# Altium schematic sheet Peripherals.SchDoc (part 1 of 2)
size A4; SheetNumber: 3; SheetTotal: 7
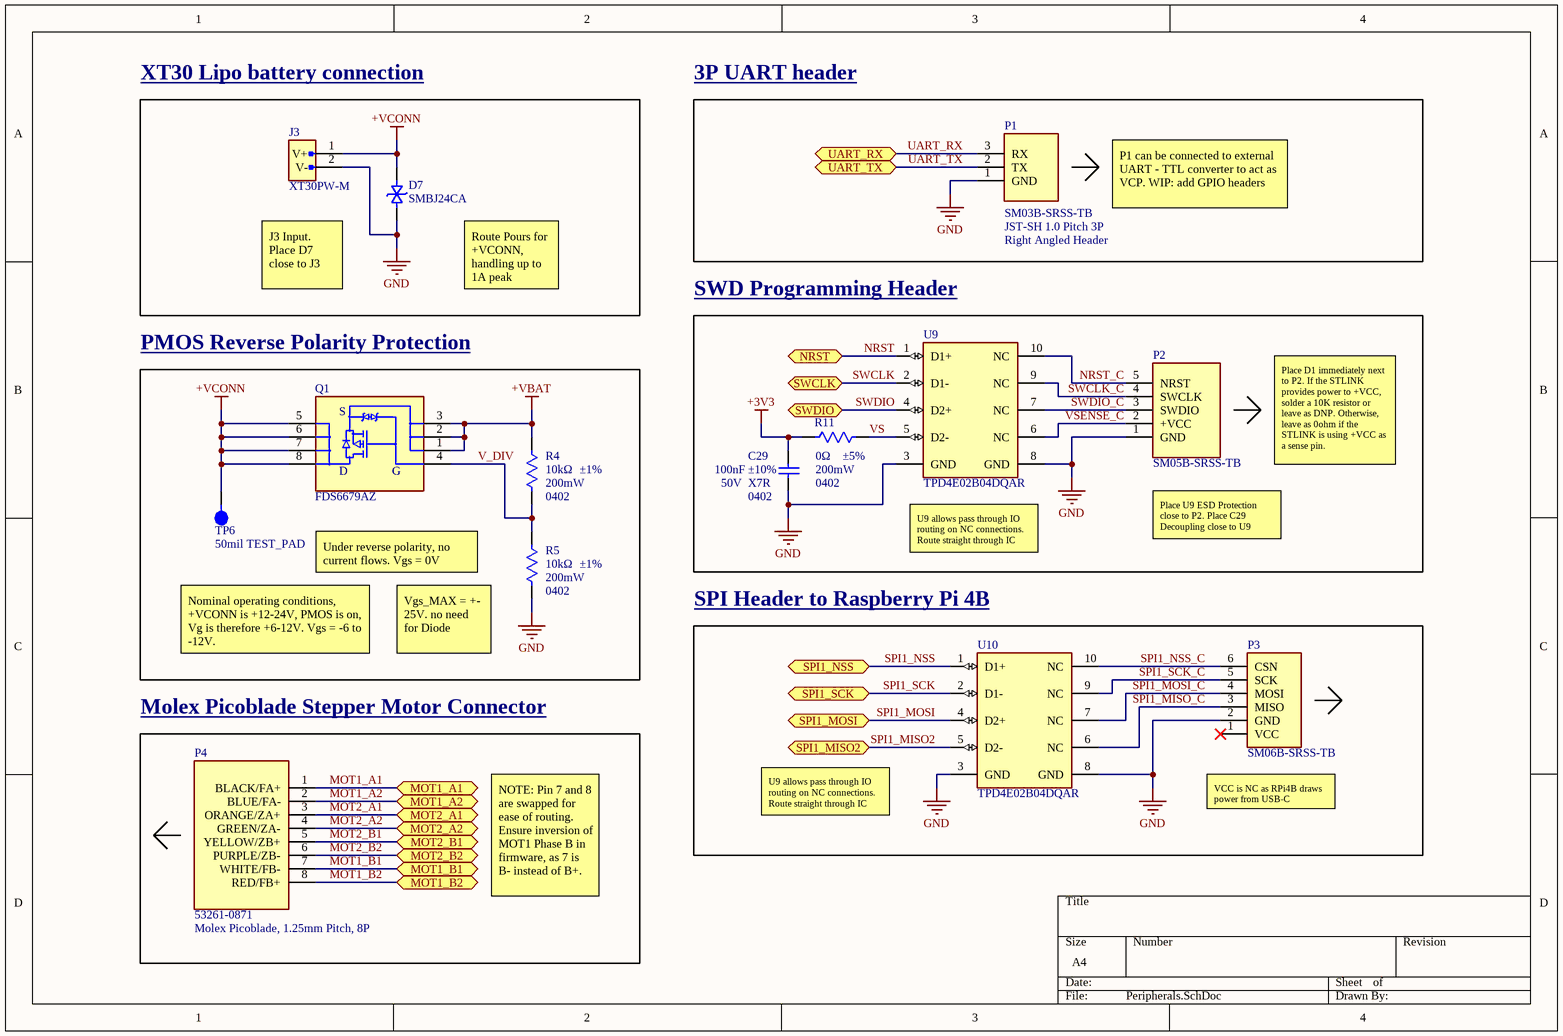
[diagram p0: Peripherals.SchDoc]

## Parts
C29  Case/Package: 0402  Voltage Rating: 50V  Dielectric: X7R  Tolerance: ±10%  [0402_Cap]  (hidden comment: 100nF)
D7  SMBJ24CA  [SMBJSeries_LTF]
J3  XT30PW-M  [AMASS_XT30PW-M]
P1  SM03B-SRSS-TB  [SM03B-SRSS-TB]
P2  SM05B-SRSS-TB  [SM05B-SRSS-TB]
P3  SM06B-SRSS-TB  [SM06B-SRSS-TB]
P4  53261-0871  [FP-532610871-MFG]
Q1  FDS6679AZ  [SOIC8_751EB_ONS]
R4  Tolerance: ±1%  Power Rating: 200mW  Case/Package: 0402  Resistance: 10kΩ  [0402_RES]  (hidden comment: 10K)
R5  Tolerance: ±1%  Power Rating: 200mW  Case/Package: 0402  Resistance: 10kΩ  [0402_RES]  (hidden comment: 10K)
R11  Tolerance: ±5%  Power Rating: 200mW  Case/Package: 0402  Resistance: 0Ω  [0402_RES]  (hidden comment: 0R)
TP6  50mil TEST_PAD  [15mil_TEST_PAD]
U9  TPD4E02B04DQAR  [FP-DQA0010A-MFG]
U10  TPD4E02B04DQAR  [FP-DQA0010A-MFG]

## Blocks framed on the sheet
XT30 Lipo battery connection: D7 J3
3P UART header: P1
SWD Programming Header: C29 P2 R11 U9
PMOS Reverse Polarity Protection: Q1 R4 R5 TP6
SPI Header to Raspberry Pi 4B: P3 U10
Molex Picoblade Stepper Motor Connector: P4

## Ports
MOT1_A1 (bidir), MOT1_A2 (bidir), MOT1_B1 (bidir), MOT1_B2 (bidir), MOT2_A1 (bidir), MOT2_A2 (bidir), MOT2_B1 (bidir), MOT2_B2 (bidir), NRST (bidir), SPI1_MISO2 (bidir), SPI1_MOSI (bidir), SPI1_NSS (bidir), SPI1_SCK (bidir), SWCLK (bidir), SWDIO (bidir), UART_RX (bidir), UART_TX (bidir)

## Nets
+3V3: C29.2 R11.1
+VBAT: Q1.1 Q1.2 Q1.3 R4.2
+VCONN: D7.2 J3.1(V+) Q1.5 Q1.6 Q1.7 Q1.8 TP6.1
GND: C29.1 D7.1 J3.2(V-) P1.1(GND) P2.1(GND) P3.2(GND) R5.1 U9.3(GND) U9.8(GND) U10.3(GND) U10.8(GND)
MOT1_A1: P4.1(BLACK/FA+) ; port MOT1_A1
MOT1_A2: P4.2(BLUE/FA-) ; port MOT1_A2
MOT1_B1: P4.7(WHITE/FB-) ; port MOT1_B1
MOT1_B2: P4.8(RED/FB+) ; port MOT1_B2
MOT2_A1: P4.3(ORANGE/ZA+) ; port MOT2_A1
MOT2_A2: P4.4(GREEN/ZA-) ; port MOT2_A2
MOT2_B1: P4.5(YELLOW/ZB+) ; port MOT2_B1
MOT2_B2: P4.6(PURPLE/ZB-) ; port MOT2_B2
NRST: U9.1(D1+) ; port NRST
NRST_C: P2.5(NRST) U9.10(NC)
SPI1_MISO2: U10.5(D2-) ; port SPI1_MISO2
SPI1_MISO_C: P3.3(MISO) U10.6(NC)
SPI1_MOSI: U10.4(D2+) ; port SPI1_MOSI
SPI1_MOSI_C: P3.4(MOSI) U10.7(NC)
SPI1_NSS: U10.1(D1+) ; port SPI1_NSS
SPI1_NSS_C: P3.6(CSN) U10.10(NC)
SPI1_SCK: U10.2(D1-) ; port SPI1_SCK
SPI1_SCK_C: P3.5(SCK) U10.9(NC)
SWCLK: U9.2(D1-) ; port SWCLK
SWCLK_C: P2.4(SWCLK) U9.9(NC)
SWDIO: U9.4(D2+) ; port SWDIO
SWDIO_C: P2.3(SWDIO) U9.7(NC)
UART_RX: P1.3(RX) ; port UART_RX
UART_TX: P1.2(TX) ; port UART_TX
V_DIV: Q1.4(G) R4.1 R5.2
VS: R11.2 U9.5(D2-)
VSENSE_C: P2.2(+VCC) U9.6(NC)

Not connected (* = marked no-connect by the designer): P3 1(VCC)*

## Notes on the sheet
- (near P1) JST-SH 1.0 Pitch 3P
- Right Angled Header
- P1 can be connected to external UART - TTL converter to act as VCP. WIP: add GPIO headers
- J3 Input. Place D7 close to J3
- Route Pours for +VCONN, handling up to 1A peak
- Place D1 immediately next to P2. If the STLINK provides power to +VCC, solder a 10K resistor or leave as DNP. Otherwise, leave as 0ohm if the STLINK is using +VCC as a sense pin.
- Under reverse polarity, no current flows. Vgs = 0V
- (near U9) U9 allows pass through IO routing on NC connections. Route straight through IC
- Place U9 ESD Protection close to P2. Place C29 Decoupling close to U9
- Nominal operating conditions, +VCONN is +12-24V, PMOS is on, Vg is therefore +6-12V. Vgs = -6 to -12V.
- (near R5) Vgs_MAX = +- 25V. no need for Diode
- U9 allows pass through IO routing on NC connections. Route straight through IC
- (near P3) VCC is NC as RPi4B draws power from USB-C
- NOTE: Pin 7 and 8 are swapped for ease of routing. Ensure inversion of MOT1 Phase B in firmware, as 7 is B- instead of B+.
- (near P4) Molex Picoblade, 1.25mm Pitch, 8P
- (in symbol FDS6679AZ) S; D